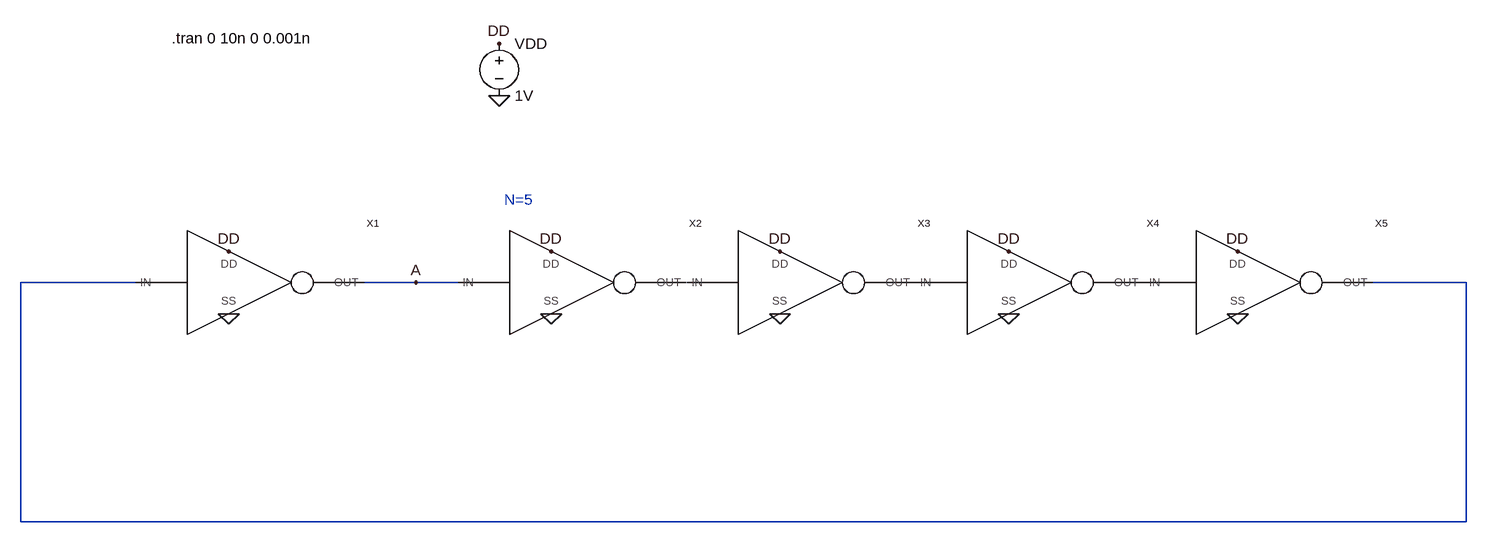
[diagram p0: schematic 2b.asc]
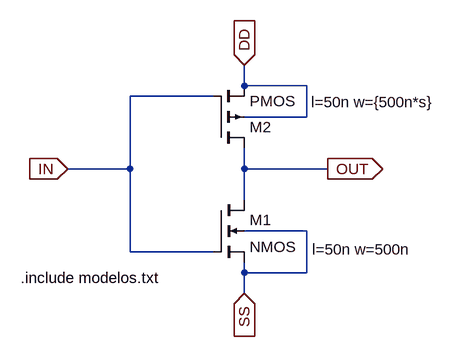
[diagram p1: sub-circuit inversorp.asc]
2b.asc, the LTspice schematic file:
Version 4
SHEET 1 2644 680
WIRE -96 160 -272 160
WIRE 336 160 256 160
WIRE 400 160 336 160
WIRE 1952 160 1808 160
WIRE -272 528 -272 160
WIRE 1952 528 1952 160
WIRE 1952 528 -272 528
FLAG 464 -128 0
FLAG 48 208 0
FLAG 464 -208 DD
FLAG 48 112 DD
FLAG 336 160 A
FLAG 544 208 0
FLAG 544 112 DD
FLAG 896 112 DD
FLAG 1248 112 DD
FLAG 1600 112 DD
FLAG 1600 208 0
FLAG 1248 208 0
FLAG 896 208 0
SYMBOL inversorp -16 160 R0
SYMATTR InstName X1
SYMBOL voltage 464 -224 R0
WINDOW 123 0 0 Left 0
WINDOW 39 0 0 Left 0
SYMATTR InstName VDD
SYMATTR Value 1V
SYMBOL inversorp 480 160 R0
SYMATTR InstName X2
SYMBOL inversorp 832 160 R0
SYMATTR InstName X3
SYMBOL inversorp 1184 160 R0
SYMATTR InstName X4
SYMBOL inversorp 1536 160 R0
SYMATTR InstName X5
TEXT -40 -216 Left 2 !.tran 0 10n 0 0.001n
TEXT 472 32 Left 2 ;N=5

inversorp.asc, the sub-circuit schematic file:
Version 4
SHEET 1 1048 680
WIRE 112 32 112 0
WIRE 208 32 112 32
WIRE 64 48 -64 48
WIRE 208 80 208 32
WIRE 208 80 112 80
WIRE -64 160 -64 48
WIRE -64 160 -160 160
WIRE 112 160 112 128
WIRE 240 160 112 160
WIRE 112 208 112 160
WIRE 208 256 112 256
WIRE -64 288 -64 160
WIRE 64 288 -64 288
WIRE 112 320 112 304
WIRE 208 320 208 256
WIRE 208 320 112 320
WIRE 112 352 112 320
FLAG 112 0 DD
IOPIN 112 0 In
FLAG -160 160 IN
IOPIN -160 160 In
FLAG 240 160 OUT
IOPIN 240 160 Out
FLAG 112 352 SS
IOPIN 112 352 In
SYMBOL nmos4 64 208 R0
WINDOW 123 152 76 Left 2
WINDOW 0 56 31 Left 2
SYMATTR Value2 l=50n w=500n
SYMATTR InstName M1
SYMBOL pmos4 64 128 M180
WINDOW 123 151 71 Left 2
SYMATTR Value2 l=50n w={500n*s}
SYMATTR InstName M2
TEXT -232 328 Left 2 !.include modelos.txt

The netlist it stands for:
* 2b.asc
XX1 DD 0 N001 A inversorp params: s=2
VDD DD 0 1V
XX2 DD 0 A P001 inversorp params: s=2
XX3 DD 0 P001 P002 inversorp params: s=2
XX4 DD 0 P002 P003 inversorp params: s=2
XX5 DD 0 P003 N001 inversorp params: s=2

* block symbol definitions
.subckt inversorp DD SS IN OUT
M1 OUT IN SS SS NMOS l=50n w=500n
M2 OUT IN DD DD PMOS l=50n w={500n*s}
.include modelos.txt
.ends inversorp

.model NMOS NMOS
.model PMOS PMOS
.lib standard.mos
.tran 0 10n 0 0.001n
* N=5
.backanno
.end